# Altium schematic sheet Single_ETU_sht3.SchDoc
size B
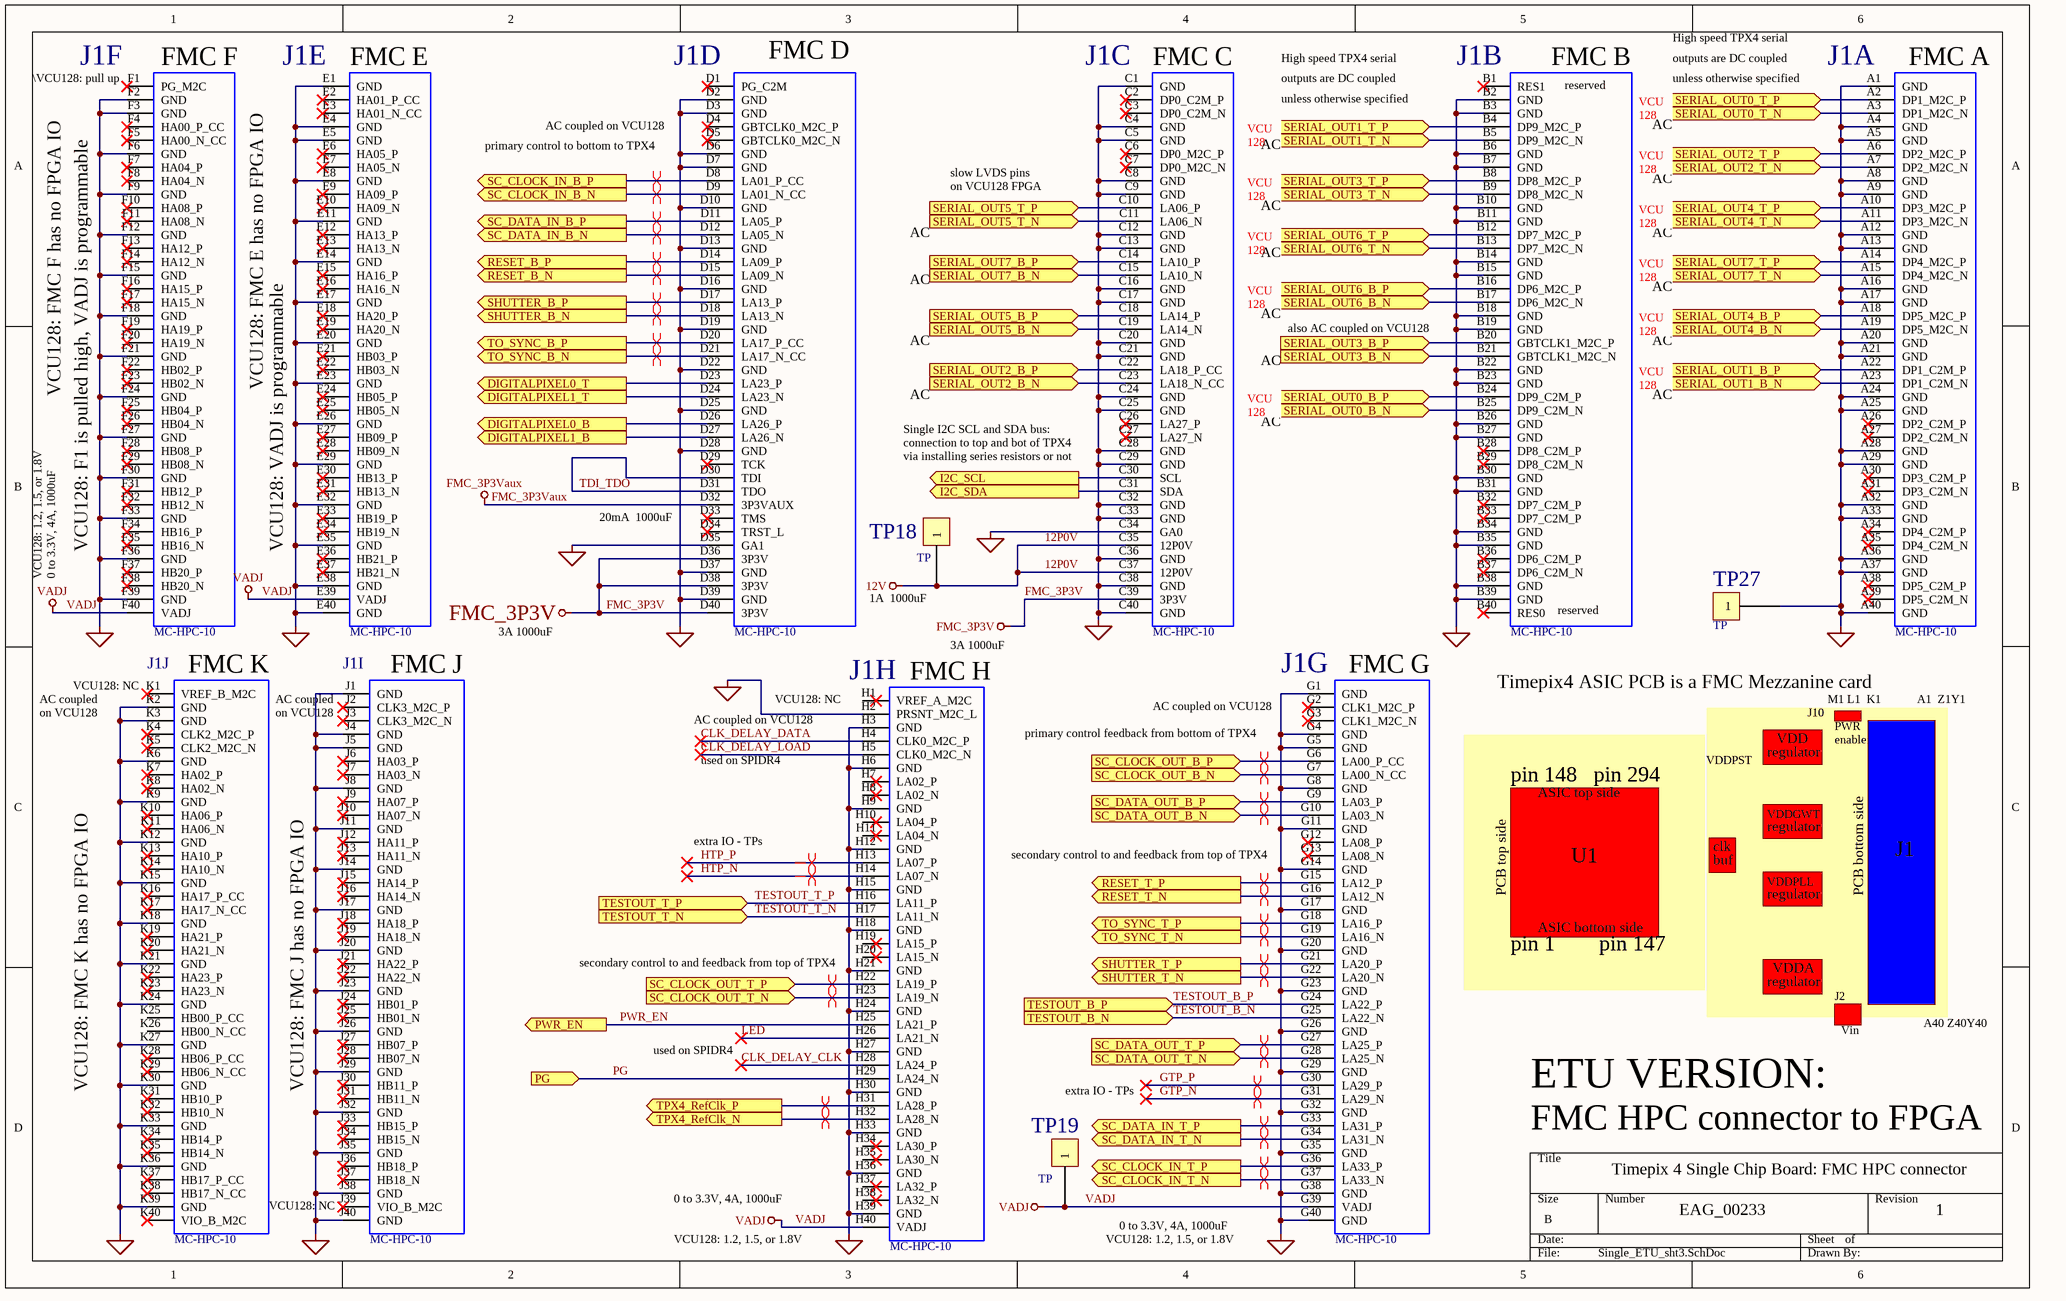
[diagram p0: Single_ETU_sht3.SchDoc]

## Parts
J1  MC-HPC-10  [ASP-134488-01]  (parts A,B,C,D,E,F,G,H,I,J of 10)
TP18  TP  [TP]
TP19  TP  [TP]
TP27  TP  [TP]

## Ports
DIGITALPIXEL0_B (out), DIGITALPIXEL0_T (out), DIGITALPIXEL1_B (out), DIGITALPIXEL1_T (out), I2C_SCL (out), I2C_SDA (out), PG (in), PWR_EN (out), RESET_B_N (out), RESET_B_P (out), RESET_T_N (out), RESET_T_P (out), SC_CLOCK_IN_B_N (out), SC_CLOCK_IN_B_P (out), SC_CLOCK_IN_T_N (out), SC_CLOCK_IN_T_P (out), SC_CLOCK_OUT_B_N (in), SC_CLOCK_OUT_B_P (in), SC_CLOCK_OUT_T_N (in), SC_CLOCK_OUT_T_P (in), SC_DATA_IN_B_N (out), SC_DATA_IN_B_P (out), SC_DATA_IN_T_N (out), SC_DATA_IN_T_P (out), SC_DATA_OUT_B_N (in), SC_DATA_OUT_B_P (in), SC_DATA_OUT_T_N (in), SC_DATA_OUT_T_P (in), SERIAL_OUT0_B_N (in), SERIAL_OUT0_B_P (in), SERIAL_OUT0_T_N (in), SERIAL_OUT0_T_P (in), SERIAL_OUT1_B_N (in), SERIAL_OUT1_B_P (in), SERIAL_OUT1_T_N (in), SERIAL_OUT1_T_P (in), SERIAL_OUT2_B_N (in), SERIAL_OUT2_B_P (in), SERIAL_OUT2_T_N (in), SERIAL_OUT2_T_P (in), SERIAL_OUT3_B_N (in), SERIAL_OUT3_B_P (in), SERIAL_OUT3_T_N (in), SERIAL_OUT3_T_P (in), SERIAL_OUT4_B_N (in), SERIAL_OUT4_B_P (in), SERIAL_OUT4_T_N (in), SERIAL_OUT4_T_P (in), SERIAL_OUT5_B_N (in), SERIAL_OUT5_B_P (in), SERIAL_OUT5_T_N (in), SERIAL_OUT5_T_P (in), SERIAL_OUT6_B_N (in), SERIAL_OUT6_B_P (in), SERIAL_OUT6_T_N (in), SERIAL_OUT6_T_P (in), SERIAL_OUT7_B_N (in), SERIAL_OUT7_B_P (in), SERIAL_OUT7_T_N (in), SERIAL_OUT7_T_P (in), SHUTTER_B_N (out), SHUTTER_B_P (out), SHUTTER_T_N (out), SHUTTER_T_P (out), TESTOUT_B_N (in), TESTOUT_B_P (in), TESTOUT_T_N (in), TESTOUT_T_P (in), TO_SYNC_B_N (out), TO_SYNC_B_P (out), TO_SYNC_T_N (out), TO_SYNC_T_P (out), TPX4_RefClk_N (out), TPX4_RefClk_P (out)

## Nets
12P0V: J1.C35(12P0V) J1.C37(12P0V) TP18.1  [also labelled 12V]
FMC_3P3V: J1.C39(3P3V) J1.D36(3P3V) J1.D38(3P3V) J1.D40(3P3V)
FMC_3P3Vaux: J1.D32(3P3VAUX)
GND: J1.A1(GND) J1.A4(GND) J1.A5(GND) J1.A8(GND) J1.A9(GND) J1.A12(GND) J1.A13(GND) J1.A16(GND) J1.A17(GND) J1.A20(GND) J1.A21(GND) J1.A24(GND) J1.A25(GND) J1.A28(GND) J1.A29(GND) J1.A32(GND) J1.A33(GND) J1.A36(GND) J1.A37(GND) J1.A40(GND) J1.B2(GND) J1.B3(GND) J1.B6(GND) J1.B7(GND) J1.B10(GND) J1.B11(GND) J1.B14(GND) J1.B15(GND) J1.B18(GND) J1.B19(GND) J1.B22(GND) J1.B23(GND) J1.B26(GND) J1.B27(GND) J1.B30(GND) J1.B31(GND) J1.B34(GND) J1.B35(GND) J1.B38(GND) J1.B39(GND) J1.C1(GND) J1.C4(GND) J1.C5(GND) J1.C8(GND) J1.C9(GND) J1.C12(GND) J1.C13(GND) J1.C16(GND) J1.C17(GND) J1.C20(GND) J1.C21(GND) J1.C24(GND) J1.C25(GND) J1.C28(GND) J1.C29(GND) J1.C32(GND) J1.C33(GND) J1.C34(GA0) J1.C36(GND) J1.C38(GND) J1.C40(GND) J1.D2(GND) J1.D3(GND) J1.D6(GND) J1.D7(GND) J1.D10(GND) J1.D13(GND) J1.D16(GND) J1.D19(GND) J1.D22(GND) J1.D25(GND) J1.D28(GND) J1.D35(GA1) J1.D37(GND) J1.D39(GND) J1.E1(GND) J1.E4(GND) J1.E5(GND) J1.E8(GND) J1.E11(GND) J1.E14(GND) J1.E17(GND) J1.E20(GND) J1.E23(GND) J1.E26(GND) J1.E29(GND) J1.E32(GND) J1.E35(GND) J1.E38(GND) J1.E40(GND) J1.F2(GND) J1.F3(GND) J1.F6(GND) J1.F9(GND) J1.F12(GND) J1.F15(GND) J1.F18(GND) J1.F21(GND) J1.F24(GND) J1.F27(GND) J1.F30(GND) J1.F33(GND) J1.F36(GND) J1.F39(GND) J1.G1(GND) J1.G4(GND) J1.G5(GND) J1.G8(GND) J1.G11(GND) J1.G14(GND) J1.G17(GND) J1.G20(GND) J1.G23(GND) J1.G26(GND) J1.G29(GND) J1.G32(GND) J1.G35(GND) J1.G38(GND) J1.G40(GND) J1.H2(PRSNT_M2C_L) J1.H3(GND) J1.H6(GND) J1.H9(GND) J1.H12(GND) J1.H15(GND) J1.H18(GND) J1.H21(GND) J1.H24(GND) J1.H27(GND) J1.H30(GND) J1.H33(GND) J1.H36(GND) J1.H39(GND) J1.J1(GND) J1.J4(GND) J1.J5(GND) J1.J8(GND) J1.J11(GND) J1.J14(GND) J1.J17(GND) J1.J20(GND) J1.J23(GND) J1.J26(GND) J1.J29(GND) J1.J32(GND) J1.J35(GND) J1.J38(GND) J1.J40(GND) J1.K2(GND) J1.K3(GND) J1.K6(GND) J1.K9(GND) J1.K12(GND) J1.K15(GND) J1.K18(GND) J1.K21(GND) J1.K24(GND) J1.K27(GND) J1.K30(GND) J1.K33(GND) J1.K36(GND) J1.K39(GND) TP27.1
VADJ: J1.E39(VADJ) J1.F40(VADJ) J1.G39(VADJ) J1.H40(VADJ) TP19.1
CLK_DELAY_CLK: J1.H28(LA24_P)
CLK_DELAY_DATA: J1.H4(CLK0_M2C_P)
CLK_DELAY_LOAD: J1.H5(CLK0_M2C_N)
DIGITALPIXEL0_B: J1.D26(LA26_P) ; port DIGITALPIXEL0_B
DIGITALPIXEL0_T: J1.D23(LA23_P) ; port DIGITALPIXEL0_T
DIGITALPIXEL1_B: J1.D27(LA26_N) ; port DIGITALPIXEL1_B
DIGITALPIXEL1_T: J1.D24(LA23_N) ; port DIGITALPIXEL1_T
GTP_N: J1.G31(LA29_N)
GTP_P: J1.G30(LA29_P)
HTP_N: J1.H14(LA07_N)
HTP_P: J1.H13(LA07_P)
I2C_SCL: J1.C30(SCL) ; port I2C_SCL
I2C_SDA: J1.C31(SDA) ; port I2C_SDA
LED: J1.H26(LA21_N)
PG: J1.H29(LA24_N) ; port PG
PWR_EN: J1.H25(LA21_P) ; port PWR_EN
RESET_B_N: J1.D15(LA09_N) ; port RESET_B_N
RESET_B_P: J1.D14(LA09_P) ; port RESET_B_P
RESET_T_N: J1.G16(LA12_N) ; port RESET_T_N
RESET_T_P: J1.G15(LA12_P) ; port RESET_T_P
SC_CLOCK_IN_B_N: J1.D9(LA01_N_CC) ; port SC_CLOCK_IN_B_N
SC_CLOCK_IN_B_P: J1.D8(LA01_P_CC) ; port SC_CLOCK_IN_B_P
SC_CLOCK_IN_T_N: J1.G37(LA33_N) ; port SC_CLOCK_IN_T_N
SC_CLOCK_IN_T_P: J1.G36(LA33_P) ; port SC_CLOCK_IN_T_P
SC_CLOCK_OUT_B_N: J1.G7(LA00_N_CC) ; port SC_CLOCK_OUT_B_N
SC_CLOCK_OUT_B_P: J1.G6(LA00_P_CC) ; port SC_CLOCK_OUT_B_P
SC_CLOCK_OUT_T_N: J1.H23(LA19_N) ; port SC_CLOCK_OUT_T_N
SC_CLOCK_OUT_T_P: J1.H22(LA19_P) ; port SC_CLOCK_OUT_T_P
SC_DATA_IN_B_N: J1.D12(LA05_N) ; port SC_DATA_IN_B_N
SC_DATA_IN_B_P: J1.D11(LA05_P) ; port SC_DATA_IN_B_P
SC_DATA_IN_T_N: J1.G34(LA31_N) ; port SC_DATA_IN_T_N
SC_DATA_IN_T_P: J1.G33(LA31_P) ; port SC_DATA_IN_T_P
SC_DATA_OUT_B_N: J1.G10(LA03_N) ; port SC_DATA_OUT_B_N
SC_DATA_OUT_B_P: J1.G9(LA03_P) ; port SC_DATA_OUT_B_P
SC_DATA_OUT_T_N: J1.G28(LA25_N) ; port SC_DATA_OUT_T_N
SC_DATA_OUT_T_P: J1.G27(LA25_P) ; port SC_DATA_OUT_T_P
SERIAL_OUT0_B_N: J1.B25(DP9_C2M_N) ; port SERIAL_OUT0_B_N
SERIAL_OUT0_B_P: J1.B24(DP9_C2M_P) ; port SERIAL_OUT0_B_P
SERIAL_OUT0_T_N: J1.A3(DP1_M2C_N) ; port SERIAL_OUT0_T_N
SERIAL_OUT0_T_P: J1.A2(DP1_M2C_P) ; port SERIAL_OUT0_T_P
SERIAL_OUT1_B_N: J1.A23(DP1_C2M_N) ; port SERIAL_OUT1_B_N
SERIAL_OUT1_B_P: J1.A22(DP1_C2M_P) ; port SERIAL_OUT1_B_P
SERIAL_OUT1_T_N: J1.B5(DP9_M2C_N) ; port SERIAL_OUT1_T_N
SERIAL_OUT1_T_P: J1.B4(DP9_M2C_P) ; port SERIAL_OUT1_T_P
SERIAL_OUT2_B_N: J1.C23(LA18_N_CC) ; port SERIAL_OUT2_B_N
SERIAL_OUT2_B_P: J1.C22(LA18_P_CC) ; port SERIAL_OUT2_B_P
SERIAL_OUT2_T_N: J1.A7(DP2_M2C_N) ; port SERIAL_OUT2_T_N
SERIAL_OUT2_T_P: J1.A6(DP2_M2C_P) ; port SERIAL_OUT2_T_P
SERIAL_OUT3_B_N: J1.B21(GBTCLK1_M2C_N) ; port SERIAL_OUT3_B_N
SERIAL_OUT3_B_P: J1.B20(GBTCLK1_M2C_P) ; port SERIAL_OUT3_B_P
SERIAL_OUT3_T_N: J1.B9(DP8_M2C_N) ; port SERIAL_OUT3_T_N
SERIAL_OUT3_T_P: J1.B8(DP8_M2C_P) ; port SERIAL_OUT3_T_P
SERIAL_OUT4_B_N: J1.A19(DP5_M2C_N) ; port SERIAL_OUT4_B_N
SERIAL_OUT4_B_P: J1.A18(DP5_M2C_P) ; port SERIAL_OUT4_B_P
SERIAL_OUT4_T_N: J1.A11(DP3_M2C_N) ; port SERIAL_OUT4_T_N
SERIAL_OUT4_T_P: J1.A10(DP3_M2C_P) ; port SERIAL_OUT4_T_P
SERIAL_OUT5_B_N: J1.C19(LA14_N) ; port SERIAL_OUT5_B_N
SERIAL_OUT5_B_P: J1.C18(LA14_P) ; port SERIAL_OUT5_B_P
SERIAL_OUT5_T_N: J1.C11(LA06_N) ; port SERIAL_OUT5_T_N
SERIAL_OUT5_T_P: J1.C10(LA06_P) ; port SERIAL_OUT5_T_P
SERIAL_OUT6_B_N: J1.B17(DP6_M2C_N) ; port SERIAL_OUT6_B_N
SERIAL_OUT6_B_P: J1.B16(DP6_M2C_P) ; port SERIAL_OUT6_B_P
SERIAL_OUT6_T_N: J1.B13(DP7_M2C_N) ; port SERIAL_OUT6_T_N
SERIAL_OUT6_T_P: J1.B12(DP7_M2C_P) ; port SERIAL_OUT6_T_P
SERIAL_OUT7_B_N: J1.C15(LA10_N) ; port SERIAL_OUT7_B_N
SERIAL_OUT7_B_P: J1.C14(LA10_P) ; port SERIAL_OUT7_B_P
SERIAL_OUT7_T_N: J1.A15(DP4_M2C_N) ; port SERIAL_OUT7_T_N
SERIAL_OUT7_T_P: J1.A14(DP4_M2C_P) ; port SERIAL_OUT7_T_P
SHUTTER_B_N: J1.D18(LA13_N) ; port SHUTTER_B_N
SHUTTER_B_P: J1.D17(LA13_P) ; port SHUTTER_B_P
SHUTTER_T_N: J1.G22(LA20_N) ; port SHUTTER_T_N
SHUTTER_T_P: J1.G21(LA20_P) ; port SHUTTER_T_P
TDI_TDO: J1.D30(TDI) J1.D31(TDO)
TESTOUT_B_N: J1.G25(LA22_N) ; port TESTOUT_B_N
TESTOUT_B_P: J1.G24(LA22_P) ; port TESTOUT_B_P
TESTOUT_T_N: J1.H17(LA11_N) ; port TESTOUT_T_N
TESTOUT_T_P: J1.H16(LA11_P) ; port TESTOUT_T_P
TO_SYNC_B_N: J1.D21(LA17_N_CC) ; port TO_SYNC_B_N
TO_SYNC_B_P: J1.D20(LA17_P_CC) ; port TO_SYNC_B_P
TO_SYNC_T_N: J1.G19(LA16_N) ; port TO_SYNC_T_N
TO_SYNC_T_P: J1.G18(LA16_P) ; port TO_SYNC_T_P
TPX4_RefClk_N: J1.H32(LA28_N) ; port TPX4_RefClk_N
TPX4_RefClk_P: J1.H31(LA28_P) ; port TPX4_RefClk_P

Not connected (* = marked no-connect by the designer): J1 A26(DP2_C2M_P)* A27(DP2_C2M_N)* A30(DP3_C2M_P)* A31(DP3_C2M_N)* A34(DP4_C2M_P)* A35(DP4_C2M_N)* A38(DP5_C2M_P)* A39(DP5_C2M_N)* B1(RES1)* B28(DP8_C2M_P)* B29(DP8_C2M_N)* B32(DP7_C2M_P)* B33(DP7_C2M_P)* B36(DP6_C2M_P)* B37(DP6_C2M_N)* B40(RES0)* C2(DP0_C2M_P)* C3(DP0_C2M_N)* C6(DP0_M2C_P)* C7(DP0_M2C_N)* C26(LA27_P)* C27(LA27_N)* D1(PG_C2M)* D4(GBTCLK0_M2C_P)* D5(GBTCLK0_M2C_N)* D29(TCK)* D33(TMS)* D34(TRST_L)* E2(HA01_P_CC)* E3(HA01_N_CC)* E6(HA05_P)* E7(HA05_N)* E9(HA09_P)* E10(HA09_N)* E12(HA13_P)* E13(HA13_N)* E15(HA16_P)* E16(HA16_N)* E18(HA20_P)* E19(HA20_N)* E21(HB03_P)* E22(HB03_N)* E24(HB05_P)* E25(HB05_N)* E27(HB09_P)* E28(HB09_N)* E30(HB13_P)* E31(HB13_N)* E33(HB19_P)* E34(HB19_N)* E36(HB21_P)* E37(HB21_N)* F1(PG_M2C)* F4(HA00_P_CC)* F5(HA00_N_CC)* F7(HA04_P)* F8(HA04_N)* F10(HA08_P)* F11(HA08_N)* F13(HA12_P)* F14(HA12_N)* F16(HA15_P)* F17(HA15_N)* F19(HA19_P)* F20(HA19_N)* F22(HB02_P)* F23(HB02_N)* F25(HB04_P)* F26(HB04_N)* F28(HB08_P)* F29(HB08_N)* F31(HB12_P)* F32(HB12_N)* F34(HB16_P)* F35(HB16_N)* F37(HB20_P)* F38(HB20_N)* G2(CLK1_M2C_P)* G3(CLK1_M2C_N)* G12(LA08_P)* G13(LA08_N)* H1(VREF_A_M2C) H7(LA02_P) H8(LA02_N) H10(LA04_P) H11(LA04_N) H19(LA15_P) H20(LA15_N) H34(LA30_P) H35(LA30_N) H37(LA32_P) H38(LA32_N) J2(CLK3_M2C_P)* J3(CLK3_M2C_N)* J6(HA03_P)* J7(HA03_N)* J9(HA07_P)* J10(HA07_N)* J12(HA11_P)* J13(HA11_N)* J15(HA14_P)* J16(HA14_N)* J18(HA18_P)* J19(HA18_N)* J21(HA22_P)* J22(HA22_N)* J24(HB01_P)* J25(HB01_N)* J27(HB07_P)* J28(HB07_N)* J30(HB11_P)* J31(HB11_N)* J33(HB15_P)* J34(HB15_N)* J36(HB18_P)* J37(HB18_N)* J39(VIO_B_M2C)* K1(VREF_B_M2C)* K4(CLK2_M2C_P)* K5(CLK2_M2C_N)* K7(HA02_P)* K8(HA02_N)* K10(HA06_P)* K11(HA06_N)* K13(HA10_P)* K14(HA10_N)* K16(HA17_P_CC)* K17(HA17_N_CC)* K19(HA21_P)* K20(HA21_N)* K22(HA23_P)* K23(HA23_N)* K25(HB00_P_CC) K26(HB00_N_CC) K28(HB06_P_CC)* K29(HB06_N_CC)* K31(HB10_P)* K32(HB10_N)* K34(HB14_P)* K35(HB14_N)* K37(HB17_P_CC)* K38(HB17_N_CC)* K40(VIO_B_M2C)*

## Layout directives
differential pair: GTP_N, GTP_P, HTP_N, HTP_P, RESET_B_N, RESET_B_P, RESET_T_N, RESET_T_P, SC_CLOCK_IN_B_N, SC_CLOCK_IN_B_P, SC_CLOCK_IN_T_N, SC_CLOCK_IN_T_P, SC_CLOCK_OUT_B_N, SC_CLOCK_OUT_B_P, SC_CLOCK_OUT_T_N, SC_CLOCK_OUT_T_P, SC_DATA_IN_B_N, SC_DATA_IN_B_P, SC_DATA_IN_T_N, SC_DATA_IN_T_P, SC_DATA_OUT_B_N, SC_DATA_OUT_B_P, SC_DATA_OUT_T_N, SC_DATA_OUT_T_P, SHUTTER_B_N, SHUTTER_B_P, SHUTTER_T_N, SHUTTER_T_P, TO_SYNC_B_N, TO_SYNC_B_P, TO_SYNC_T_N, TO_SYNC_T_P, TPX4_RefClk_N, TPX4_RefClk_P

## Notes on the sheet
- (near J1) \VCU128: pull up
- (near J1) FMC F
- (near J1) FMC E
- (near J1) FMC D
- (near J1) FMC C
- High speed TPX4 serial
- outputs are DC coupled
- unless otherwise specified
- (near J1) FMC B
- reserved
- (near J1) FMC A
- (near J1) primary control to bottom to TPX4
- AC coupled on VCU128
- VCU
  128
- AC
- slow LVDS pins
- on VCU128 FPGA
- also AC coupled on VCU128
- VCU128: FMC F has no FPGA IO
- VCU128: FMC E has no FPGA IO
- Single I2C SCL and SDA bus:
- (near J1) connection to top and bot of TPX4
- (near J1) via installing series resistors or not
- VCU128: F1 is pulled high, VADJ is programmable
- VCU128: VADJ is programmable
- 20mA  1000uF
- VCU128: 1.2, 1.5, or 1.8V
- 0 to 3.3V, 4A, 1000uF
- 3A 1000uF
- (near TP18) 1A  1000uF
- (near J1) reserved
- AC coupled
- (near J1) VCU128: NC
- (near J1) FMC K
- (near J1) AC coupled
- (near J1) FMC J
- VCU128: NC
- (near J1) FMC H
- (near J1) FMC G
- Timepix4 ASIC PCB is a FMC Mezzanine card
- M1 L1  K1            A1  Z1Y1
- on VCU128
- (near J1) on VCU128
- used on SPIDR4
- (near J1) primary control feedback from bottom of TPX4
- VDDPST
- regulator
- VDD
- J10
- PWR
- enable
- pin 148   pin 294
- ASIC top side
- VDDGWT
- extra IO - TPs
- (near J1) secondary control to and feedback from top of TPX4
- PCB top side
- U1
- clk
- buf
- VDDPLL
- PCB bottom side
- J1
- pin 1        pin 147
- ASIC bottom side
- VDDA
- J2
- Vin
- A40 Z40Y40
- VCU128: FMC K has no FPGA IO
- VCU128: FMC J has no FPGA IO
- ETU VERSION:
- FMC HPC connector to FPGA
- Timepix 4 Single Chip Board: FMC HPC connector
- EAG_00233
- 1

## Library data of the parts
J1 = MC-HPC-10: MC-HPC-10, FMC High-pin count connector, lead free, 400 I/Os, male, 10 mm mated stack height; Manufacturer: Samtec; Manufacturer Ref: SEAM-40-03.5-S-10-2-A-K-TR-VITA57.0; Pitch: 1.27 mm; Mated Stack Height: 10 mm; Solder Type: Lead-Free; Number I/O: 400; PartName: ASP-134488-01; Part: ASP-134488-01; Vita PartNumber: MC-HPC-10; Pin Count: High; Gender: male; Supplier 1: Digi-Key; Supplier Part Number 1: SAM8730-ND
TP18 TP19 TP27 = TP: test point, wire bonding site